# EasyEDA Pro project HEMY-2R-board.epro, schematic HEMY Redux v2.6.5M, sheet 3 of 3

## Sheets
3 Brake: Board Name: HEMY TeenAstro Redux v2.6.5M; Create Date: 2026-11-18; Page Name: Brake; Project Name: HEMY 2R board; Schematic Name: HEMY Redux v2.6.5M; Update Date: 2026-11-18; Company: EasyEDA.com; Page Size: A3; Version: V1.0
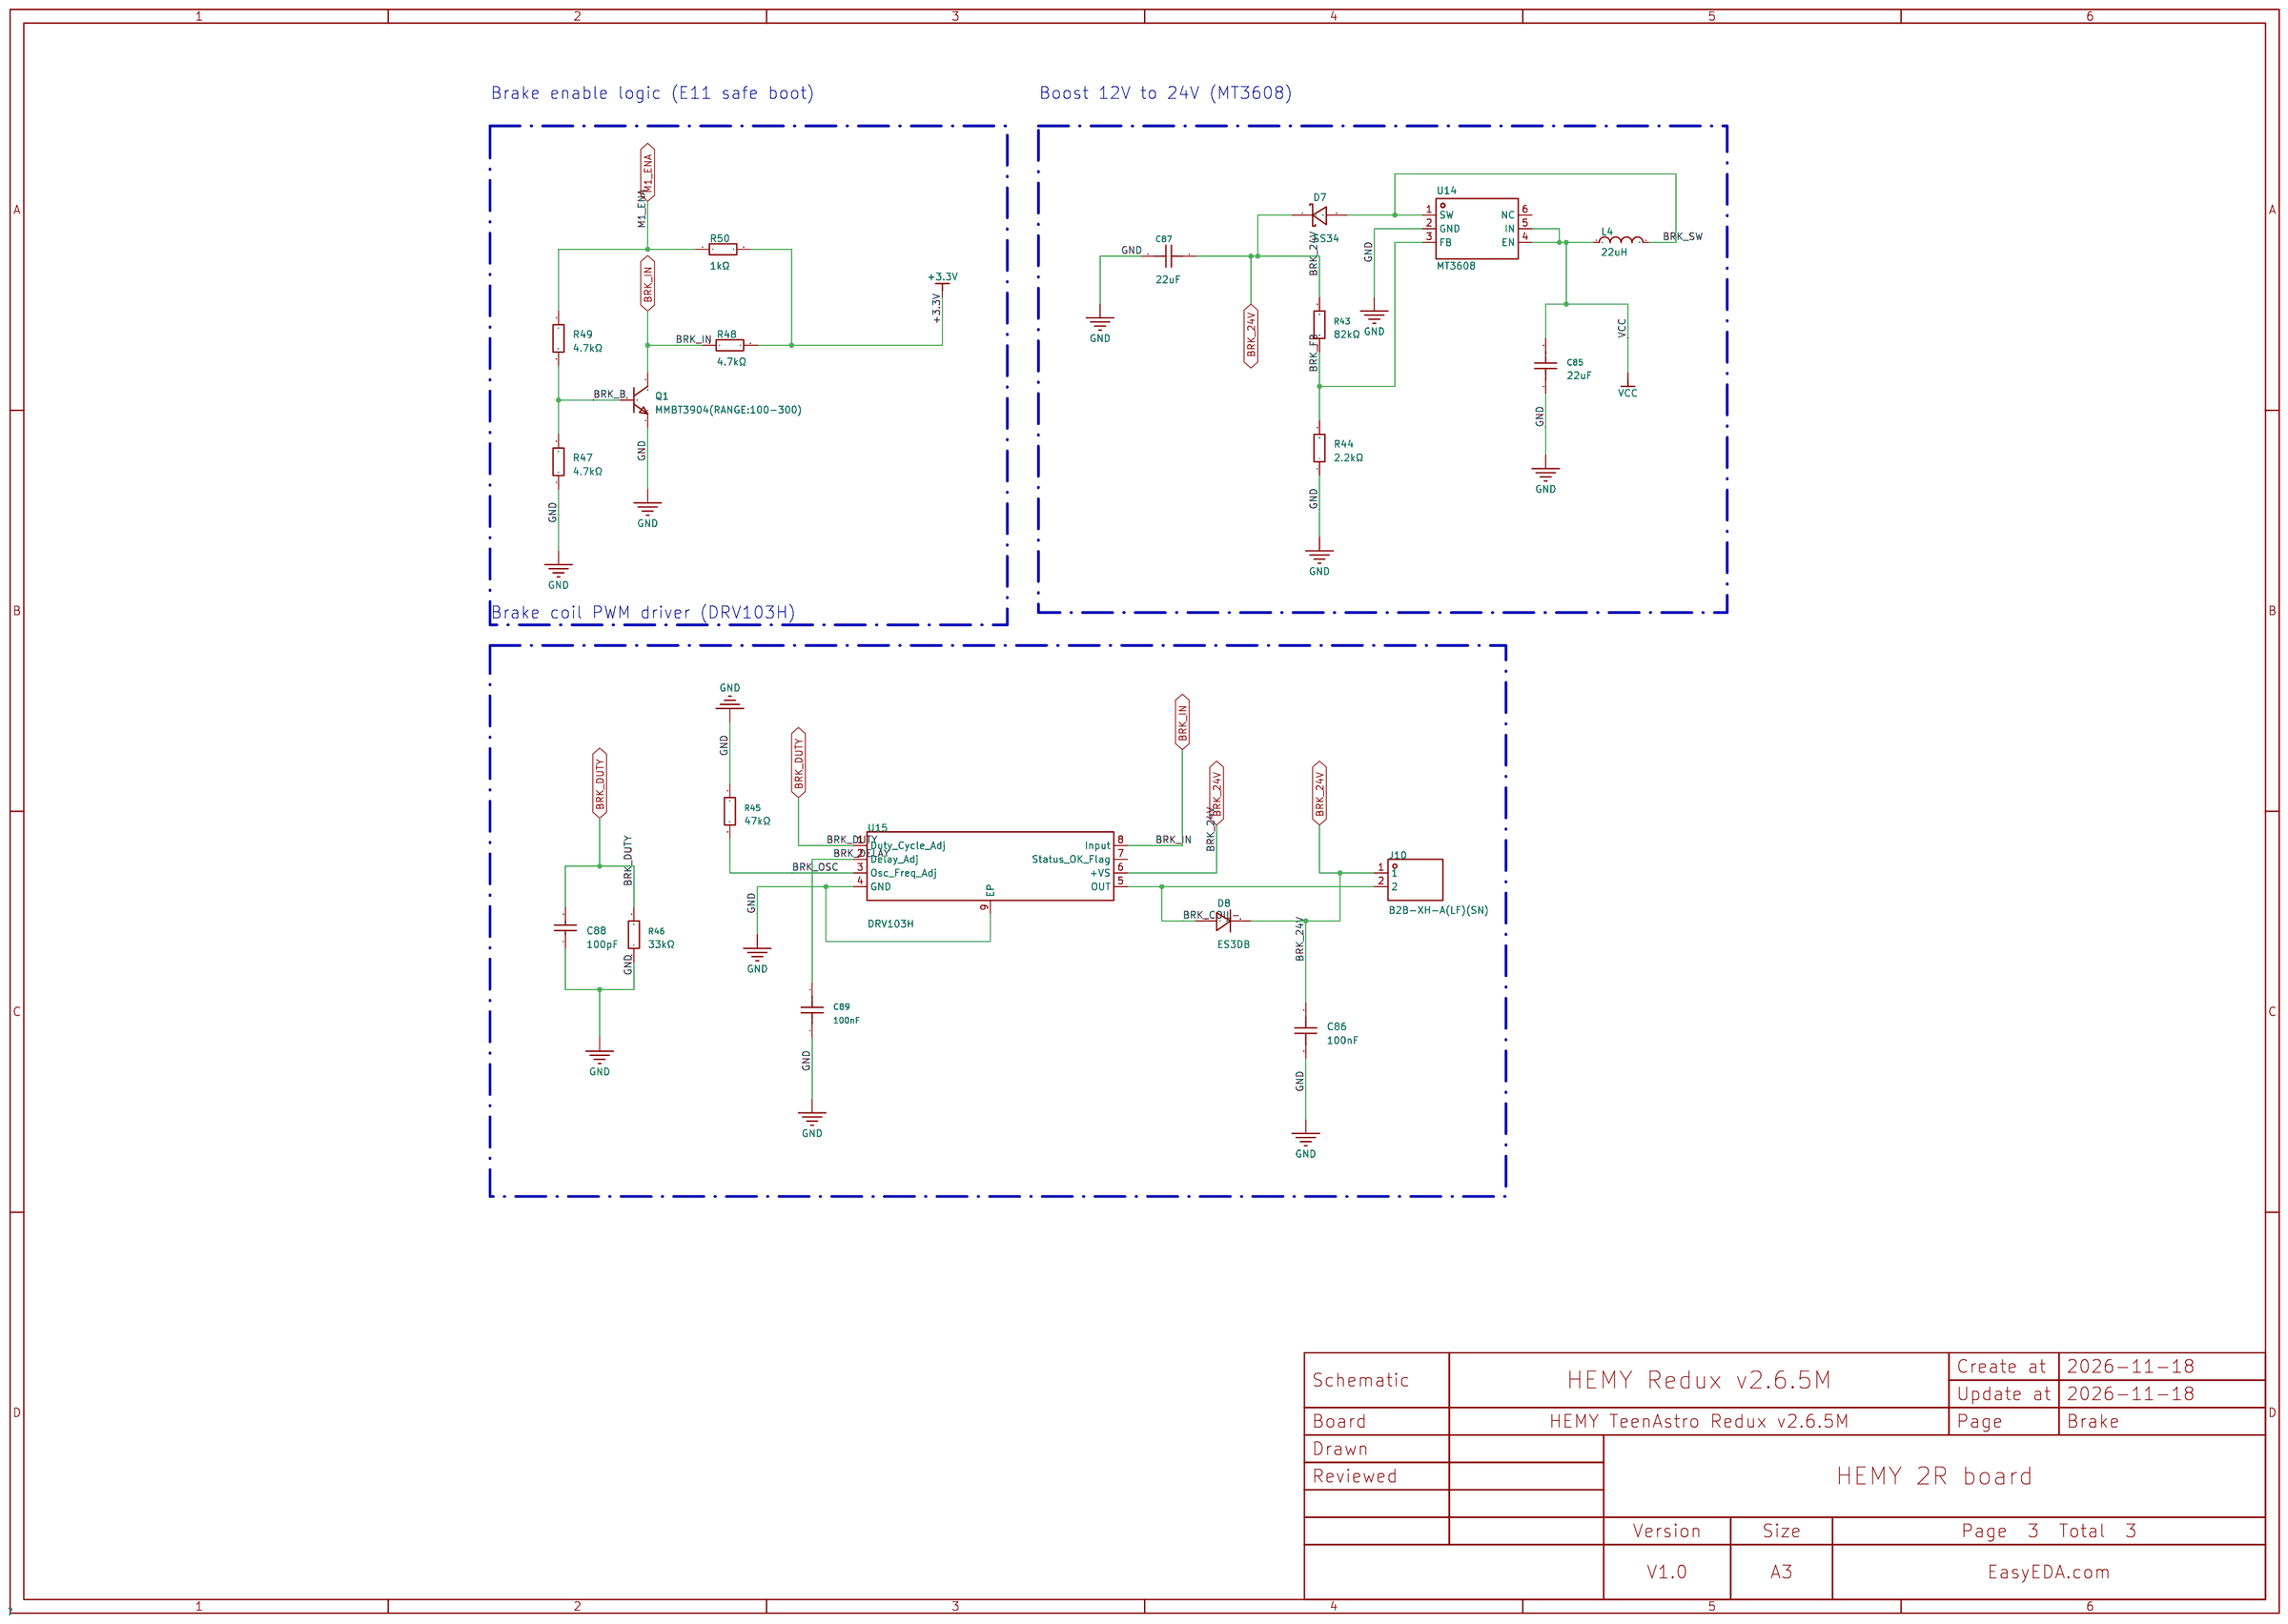
[diagram p2: Brake]

## Parts
C85  22uF  [C0805]
C86  100nF  [C0805]
C87  22uF  [C0805]
C88  100pF  [C0603]
C89  100nF  [C0603]
D7  SS34  [SMA_L4.3-W2.6-LS5.2-RD]
D8  ES3DB  [SMB_L4.6-W3.6-LS5.3-RD]
J10  B2B-XH-A(LF)(SN)  [CONN-TH_B2B-XH-A-LF-SN]
L4  22uH  [IND-SMD_L7.3-W6.6]
Q1  MMBT3904(RANGE:100-300)  [SOT-23-3_L2.9-W1.3-P1.90-LS2.4-BR]
R43  82kΩ  [R0603]
R44  2.2kΩ  [R0603]
R45  47kΩ  [R0603]
R46  33kΩ  [R0603]
R47  4.7kΩ  [R0603]
R48  4.7kΩ  [R0603]
R49  4.7kΩ  [R0603]
R50  1kΩ  [R0603]
U14  MT3608  [SOT-23-6_L2.9-W1.6-P0.95-LS2.8-BL]
U15  DRV103H  [POWERPAD-SO-8_L4.9-W3.9-P1.27-LS6.0-BL-EP2.3]

## Library data of the parts
C85 C87 = CGA0805X5R226M350MT: Capacitance:22uF Tolerance:±20% Tolerance:±20% Voltage Rating:35V Temperature Coefficient:X5R; LCSC Part Name: 22uF ±20% 35V; Supplier Part: C6119901; Manufacturer: HRE(芯声); Supplier Footprint: 0805; JLCPCB Part Class: Extended Part; Datasheet: https://item.szlcsc.com/datasheet/CGA0805X5R226M350MT/7062607.html; Supplier: LCSC; Tolerance: ±20%; Voltage Rating: 35V; Temperature Coefficient: X5R; EasyEDA Copilot Part Ref: {"uuid":"8399186da6f74547860e1334406de83d","libraryUuid":"lcsc"}
C86 = CC0805KRX7R9BB104: Capacitance:100nF Tolerance:±10% Tolerance:±10% Voltage Rating:50V Temperature Coefficient:X7R; LCSC Part Name: 100nF ±10% 50V; Supplier Part: C49678; Manufacturer: YAGEO(国巨); Supplier Footprint: 0805; JLCPCB Part Class: Basic Part; Datasheet: https://item.szlcsc.com/datasheet/CC0805KRX7R9BB104/50686.html; Supplier: LCSC; Tolerance: ±10%; Voltage Rating: 50V; Temperature Coefficient: X7R; EasyEDA Copilot Part Ref: {"uuid":"1fcffeacebec4bcab600894243e1bb8c","libraryUuid":"lcsc"}
C88 = CL10C101JB8NNNC: Capacitance:100pF Tolerance:±5% Tolerance:±5% Voltage Rating:50V Temperature Coefficient:C0G; LCSC Part Name: 100pF ±5% 50V; Supplier Part: C14858; Manufacturer: SAMSUNG(三星); Supplier Footprint: 0603; JLCPCB Part Class: Basic Part; Datasheet: https://item.szlcsc.com/datasheet/CL10C101JB8NNNC/15530.html; Supplier: LCSC; Tolerance: ±5%; Voltage Rating: 50V; Temperature Coefficient: C0G; EasyEDA Copilot Part Ref: {"uuid":"8e2066dcddc04bbbaec8059659608eed","libraryUuid":"lcsc"}
C89 = CC0603KRX7R9BB104: Capacitance:100nF Tolerance:±10% Tolerance:±10% Voltage Rating:50V Temperature Coefficient:X7R; LCSC Part Name: 100nF ±10% 50V; Supplier Part: C14663; Manufacturer: YAGEO(国巨); Supplier Footprint: 0603; JLCPCB Part Class: Basic Part; Datasheet: https://item.szlcsc.com/datasheet/CC0603KRX7R9BB104/15331.html; Supplier: LCSC; Tolerance: ±10%; Voltage Rating: 50V; Temperature Coefficient: X7R; EasyEDA Copilot Part Ref: {"uuid":"a299e4f29fd2469688f76621c3d59c4d","libraryUuid":"lcsc"}
D7 = SS34_C8678: Diode Configuration:Standalone Voltage - Forward(Vf@If):550mV@3A Voltage - DC Reverse(Vr):40V Current - Rectified:3A Reverse Leakage Current (Ir):500uA@40V Operating Junction Temperature Range:-55℃~+125℃ Operating Junction Temperature Range:-55℃~+125℃ Non; LCSC Part Name: 电压:40V 电流:3A; Supplier Part: C8678; Manufacturer: MDD(辰达半导体); Supplier Footprint: SMA(DO-214AC); JLCPCB Part Class: Basic Part; Datasheet: https://item.szlcsc.com/datasheet/SS34/9178.html; Supplier: LCSC; Diode Configuration: Standalone; Voltage - Forward(Vf@If): 550mV@3A; Voltage - DC Reverse(Vr): 40V; Current - Rectified: 3A; Reverse Leakage Current (Ir): 500uA@40V; Operating Junction Temperature Range: -55℃~+125℃; Non-Repetitive Peak Forward Surge Current: 80A; EasyEDA Copilot Part Ref: {"uuid":"804240ef97df427480be2a5281ccea31","libraryUuid":"lcsc"}
D8 = ES3DB_C64975: Diode Configuration:1 Independent Voltage - Forward(Vf@If):1.25V@3A Voltage - DC Reverse(Vr):200V Current - Rectified:3A Reverse Leakage Current (Ir):5uA@200V Reverse Recovery Time (trr):35ns Operating Junction Temperature Range:-55℃~+150℃ Operating Junct; LCSC Part Name: 耐压:200V 电流:3A 反向恢复时间：35ns; Supplier Part: C64975; Manufacturer: MDD(辰达半导体); Supplier Footprint: DO-214AA(SMB); JLCPCB Part Class: Extended Part; Datasheet: https://item.szlcsc.com/datasheet/ES3DB/66045.html; Supplier: LCSC; Diode Configuration: 1 Independent; Voltage - Forward(Vf@If): 1.25V@3A; Voltage - DC Reverse(Vr): 200V; Current - Rectified: 3A; Reverse Leakage Current (Ir): 5uA@200V; Reverse Recovery Time (trr): 35ns; Operating Junction Temperature Range: -55℃~+150℃; Non-Repetitive Peak Forward Surge Current: 90A; EasyEDA Copilot Part Ref: {"uuid":"1b2a8e26cad842f09c3494125a973787","libraryUuid":"lcsc"}
J10 = B2B-XH-A(LF)(SN): Pins Structure:1x2P Pitch:2.5mm Mounting Type:Through Hole Reference Series:XH Number of Pins:2P Number of Rows:1 Number of PINs Per Row:2 Row Spacing:- Current Rating:3A Contact Material:Brass Contact Plating:Tin Operating Temperature:-25℃~+85℃ Operating; LCSC Part Name: 1x2P 间距:2.5mm 直插 系列:XH; Supplier Part: C158012; Manufacturer: JST; Supplier Footprint: 插件,P=2.5mm; JLCPCB Part Class: Extended Part; Datasheet: https://item.szlcsc.com/datasheet/B2B-XH-A(LF)(SN)/169360.html; Supplier: LCSC; Pins Structure: 1x2P; Pitch: 2.5mm; Mounting Type: Through Hole; Reference Series: XH; Number of Pins: 2P; Number of Rows: 1; Number of PINs Per Row: 2; Current Rating: 3A; Contact Material: Brass; Contact Plating: Tin; Operating Temperature: -25℃~+85℃; Voltage Rating: 250V; Plastic Material: PA66; Flame Retardant Rating: UL94V-0; Supplementary Features: K Pin; Color: White; Z-Height of the Board: 7mm; X-Length of Bottom Edge on Board (Spacing Line): 7.4mm; Y-Width of Bottom Edge on Board: 5.75mm; EasyEDA Copilot Part Ref: {"uuid":"4d018698282b47d4893c87aca1c32f67","libraryUuid":"lcsc"}
L4 = BMRA00060630220MA1: Inductance:22uH Tolerance:±20% Tolerance:±20% Current Rating:3A Current - Saturation(Isat):3.2A DC Resistance(DCR):145mΩ Type:Magnetic Shielded Inductor Ratings:-; LCSC Part Name: 22uH ±20% 3.2A; Supplier Part: C2838326; Manufacturer: Chilisin(奇力新); Supplier Footprint: SMD,7.3x6.6mm; JLCPCB Part Class: Extended Part; Datasheet: https://item.szlcsc.com/datasheet/BMRA00060630220MA1/3012651.html; Supplier: LCSC; Tolerance: ±20%; Current Rating: 3A; Current - Saturation(Isat): 3.2A; DC Resistance(DCR): 145mΩ; Type: Magnetic Shielded Inductor; EasyEDA Copilot Part Ref: {"uuid":"6c65689cd1814292b2f05ba00ed51f6e","libraryUuid":"lcsc"}
Q1 = MMBT3904(RANGE:100-300): type:NPN Current - Collector(Ic):200mA Collector - Emitter Voltage VCEO:40V Pd - Power Dissipation:200mW DC Current Gain:100 DC Current Gain:100 Transition frequency(fT):300MHz Current - Collector Cutoff:100nA Vce Saturation(VCE(sat)):300mV Operating Temp; LCSC Part Name: hfe=100~300 NPN 电流:200mA 电压:40V; Supplier Part: C20526; Manufacturer: CJ(江苏长电/长晶); Supplier Footprint: SOT-23; JLCPCB Part Class: Basic Part; Datasheet: https://item.szlcsc.com/datasheet/MMBT3904(RANGE%253A100-300)/21237.html; Supplier: LCSC; type: NPN; Current - Collector(Ic): 200mA; Collector - Emitter Voltage VCEO: 40V; Pd - Power Dissipation: 200mW; DC Current Gain: 100; Transition frequency(fT): 300MHz; Current - Collector Cutoff: 100nA; Vce Saturation(VCE(sat)): 300mV; Operating Temperature: -55℃~+150℃; Emitter-Base Voltage(Vebo): 6V; Number: 1 NPN; Configuration: Standalone; EasyEDA Copilot Part Ref: {"uuid":"79a17a80cabd40719b597fdc7a56f7bb","libraryUuid":"lcsc"}
R43 = 0603WAF8202T5E: Type:Thick Film Resistor Resistance:82kΩ Tolerance:±1% Tolerance:±1% Power(Watts):100mW Voltage-Supply(Max):75V Temperature Coefficient:±100ppm/℃ Temperature Coefficient:±100ppm/℃ Operating Temperature:-55℃~+155℃ Operating Temperature:-55℃~+155℃; LCSC Part Name: 82kΩ ±1% 100mW 厚膜电阻; Supplier Part: C23254; Manufacturer: UNI-ROYAL(厚声); Supplier Footprint: 0603; JLCPCB Part Class: Basic Part; Datasheet: https://item.szlcsc.com/datasheet/0603WAF8202T5E/23981.html; Supplier: LCSC; Type: Thick Film Resistor; Tolerance: ±1%; Power(Watts): 100mW; Voltage-Supply(Max): 75V; Temperature Coefficient: ±100ppm/℃; Operating Temperature: -55℃~+155℃; EasyEDA Copilot Part Ref: {"uuid":"e7430550b99b4e31a5c885b865dde147","libraryUuid":"lcsc"}
R44 = 0603WAF2201T5E_C4190: Type:Thick Film Resistor Resistance:2.2kΩ Tolerance:±1% Tolerance:±1% Power(Watts):100mW Voltage-Supply(Max):75V Temperature Coefficient:±100ppm/℃ Temperature Coefficient:±100ppm/℃ Operating Temperature:-55℃~+155℃ Operating Temperature:-55℃~+155℃; LCSC Part Name: 厚膜电阻 2.2kΩ ±1%; Supplier Part: C4190; Manufacturer: UNI-ROYAL(厚声); Manufacturer Part: 0603WAF2201T5E; Supplier Footprint: 0603; JLCPCB Part Class: Basic Part; Datasheet: https://item.szlcsc.com/datasheet/0603WAF2201T5E/4597.html; Supplier: LCSC; Type: Thick Film Resistor; Tolerance: ±1%; Power(Watts): 100mW; Voltage-Supply(Max): 75V; Temperature Coefficient: ±100ppm/℃; Operating Temperature: -55℃~+155℃; EasyEDA Copilot Part Ref: {"uuid":"be60f304bdf4486e908bd15535a43c6d","libraryUuid":"lcsc"}
R45 = 0603WAF4702T5E: Type:Thick Film Resistor Resistance:47kΩ Tolerance:±1% Tolerance:±1% Power(Watts):100mW Voltage-Supply(Max):75V Temperature Coefficient:±100ppm/℃ Temperature Coefficient:±100ppm/℃ Operating Temperature:-55℃~+155℃ Operating Temperature:-55℃~+155℃; LCSC Part Name: 厚膜电阻 47kΩ ±1%; Supplier Part: C25819; Manufacturer: UNI-ROYAL(厚声); Supplier Footprint: 0603; JLCPCB Part Class: Basic Part; Datasheet: https://item.szlcsc.com/datasheet/0603WAF4702T5E/26562.html; Supplier: LCSC; Type: Thick Film Resistor; Tolerance: ±1%; Power(Watts): 100mW; Voltage-Supply(Max): 75V; Temperature Coefficient: ±100ppm/℃; Operating Temperature: -55℃~+155℃; EasyEDA Copilot Part Ref: {"uuid":"b37953171ed04bc6822268db8e82ce1c","libraryUuid":"lcsc"}
R46 = 0603WAF3302T5E: Type:Thick Film Resistor Resistance:33kΩ Tolerance:±1% Tolerance:±1% Power(Watts):100mW Voltage-Supply(Max):75V Temperature Coefficient:±100ppm/℃ Temperature Coefficient:±100ppm/℃ Operating Temperature:-55℃~+155℃ Operating Temperature:-55℃~+155℃; LCSC Part Name: 厚膜电阻 33kΩ ±1%; Supplier Part: C4216; Manufacturer: UNI-ROYAL(厚声); Supplier Footprint: 0603; JLCPCB Part Class: Basic Part; Datasheet: https://item.szlcsc.com/datasheet/0603WAF3302T5E/4623.html; Supplier: LCSC; Type: Thick Film Resistor; Tolerance: ±1%; Power(Watts): 100mW; Voltage-Supply(Max): 75V; Temperature Coefficient: ±100ppm/℃; Operating Temperature: -55℃~+155℃; EasyEDA Copilot Part Ref: {"uuid":"7d526eeca0714686adc6896633c4a152","libraryUuid":"lcsc"}
R47-R49 = 0603WAF4701T5E: Type:Thick Film Resistor Resistance:4.7kΩ Tolerance:±1% Tolerance:±1% Power(Watts):100mW Voltage-Supply(Max):75V Temperature Coefficient:±100ppm/℃ Temperature Coefficient:±100ppm/℃ Operating Temperature:-55℃~+155℃ Operating Temperature:-55℃~+155℃; LCSC Part Name: 厚膜电阻 4.7kΩ ±1%; Supplier Part: C23162; Manufacturer: UNI-ROYAL(厚声); Supplier Footprint: 0603; JLCPCB Part Class: Basic Part; Datasheet: https://item.szlcsc.com/datasheet/0603WAF4701T5E/23889.html; Supplier: LCSC; Type: Thick Film Resistor; Tolerance: ±1%; Power(Watts): 100mW; Voltage-Supply(Max): 75V; Temperature Coefficient: ±100ppm/℃; Operating Temperature: -55℃~+155℃; EasyEDA Copilot Part Ref: {"uuid":"4c1efea8e0884946a0b9422079d22f25","libraryUuid":"lcsc"}
R50 = 0603WAF1001T5E: Type:Thick Film Resistor Resistance:1kΩ Tolerance:±1% Tolerance:±1% Power(Watts):100mW Voltage-Supply(Max):75V Temperature Coefficient:±100ppm/℃ Temperature Coefficient:±100ppm/℃ Operating Temperature:-55℃~+155℃ Operating Temperature:-55℃~+155℃; LCSC Part Name: 1kΩ ±1% 100mW 厚膜电阻; Supplier Part: C21190; Manufacturer: UNI-ROYAL(厚声); Supplier Footprint: 0603; JLCPCB Part Class: Basic Part; Datasheet: https://item.szlcsc.com/datasheet/0603WAF1001T5E/21904.html; Supplier: LCSC; Type: Thick Film Resistor; Tolerance: ±1%; Power(Watts): 100mW; Voltage-Supply(Max): 75V; Temperature Coefficient: ±100ppm/℃; Operating Temperature: -55℃~+155℃; EasyEDA Copilot Part Ref: {"uuid":"2340647df7144fc5a30489ed06518eb5","libraryUuid":"lcsc"}
U14 = MT3608: Function:Boost Voltage - Supply:2V~24V Voltage - Supply:2V~24V Output Voltage:600mV~28V Output Voltage:600mV~28V Output Current:4A Frequency - Switching:1.2MHz Frequency - Switching:1.2MHz Operating Temperature:-40℃~+85℃ Operating Temperature:-40℃~+85℃ Sy; LCSC Part Name: 老版本 升压型 2A 2V~24V; Supplier Part: C84817; Manufacturer: 西安航天民芯; Supplier Footprint: SOT-23-6; JLCPCB Part Class: Extended Part; Datasheet: https://item.szlcsc.com/datasheet/MT3608/85988.html; Supplier: LCSC; Function: Boost; Voltage - Supply: 2V~24V; Output Voltage: 600mV~28V; Output Current: 4A; Frequency - Switching: 1.2MHz; Operating Temperature: -40℃~+85℃; Synchronous Rectifier: No; Number of Outputs: 1; Topology: Boost; Quiescent Current: 100uA；1.6mA; Switch tube (built-in/external): Built-in; Output Type: Adjustable; Features: Light load efficient mode；Overcurrent Protection; EasyEDA Copilot Part Ref: {"uuid":"f42b51ab2afc4d9db90725b5f9dacdaa","libraryUuid":"lcsc"}
U15 = DRV103H: Number of Channels:- Voltage - Supply:8V~32V Voltage - Supply:8V~32V Output Current:3A Output Current:3A Peak Current:- RDS(on):500mΩ Operating Temperature:-40℃~+85℃ Operating Temperature:-40℃~+85℃ Input Logic Level - High:2.2V~5.5V Input Logic Level - Hi; LCSC Part Name: PWM低边驱动器（1.5A和3A），适用于螺线管、线圈、阀门、加热器和灯具; Supplier Part: C1556557; Manufacturer: TI(德州仪器); Supplier Footprint: SO-8; JLCPCB Part Class: Extended Part; Datasheet: https://www.ti.com/cn/lit/ds/symlink/drv103.pdf; Supplier: LCSC; Voltage - Supply: 8V~32V; Output Current: 3A; RDS(on): 500mΩ; Operating Temperature: -40℃~+85℃; Input Logic Level - High: 2.2V~5.5V; Input Logic Level - Low: 0V~1.2V; Features: Overcurrent Protection; EasyEDA Copilot Part Ref: {"uuid":"c886f6e607f348fd854ee78453d084a8","libraryUuid":"lcsc"}

## Nets
+3.3V: R48.2 R50.2 ; also on sheet 1 2
GND: C85.1 C86.2 C87.1 C88.1 C89.1 Q1.2(E) R44.1 R45.1 R46.1 R47.1 U14.2(GND) U15.4(GND) U15.9(EP) ; also on sheet 1 2
VCC: C85.2 L4.1 U14.4(EN) U14.5(IN) ; also on sheet 2
BRK_24V: C86.1 C87.2 D7.1(K) D8.1(C) J10.1 R43.1 U15.6(+VS)
BRK_B: Q1.1(B) R47.2 R49.2
BRK_COIL-: D8.2(A) J10.2 U15.5(OUT)
BRK_DELAY: C89.2 U15.2(Delay Adj)
BRK_DUTY: C88.2 R46.2 U15.1(Duty Cycle Adj)
BRK_FB: R43.2 R44.2 U14.3(FB)
BRK_IN: Q1.3(C) R48.1 U15.8(Input)
BRK_OSC: R45.2 U15.3(Osc Freq Adj)
BRK_SW: D7.2(A) L4.2 U14.1(SW)
M1_ENA: R49.1 R50.1 ; also on sheet 1 2

Not connected (* = marked no-connect by the designer): U14 6(NC); U15 7(Status OK Flag)

## Notes on the sheets
sheet 3
- Brake enable logic (E11 safe boot)
- Boost 12V to 24V (MT3608)
- Brake coil PWM driver (DRV103H)
